# Altium project IMD test box finale.PrjPcb
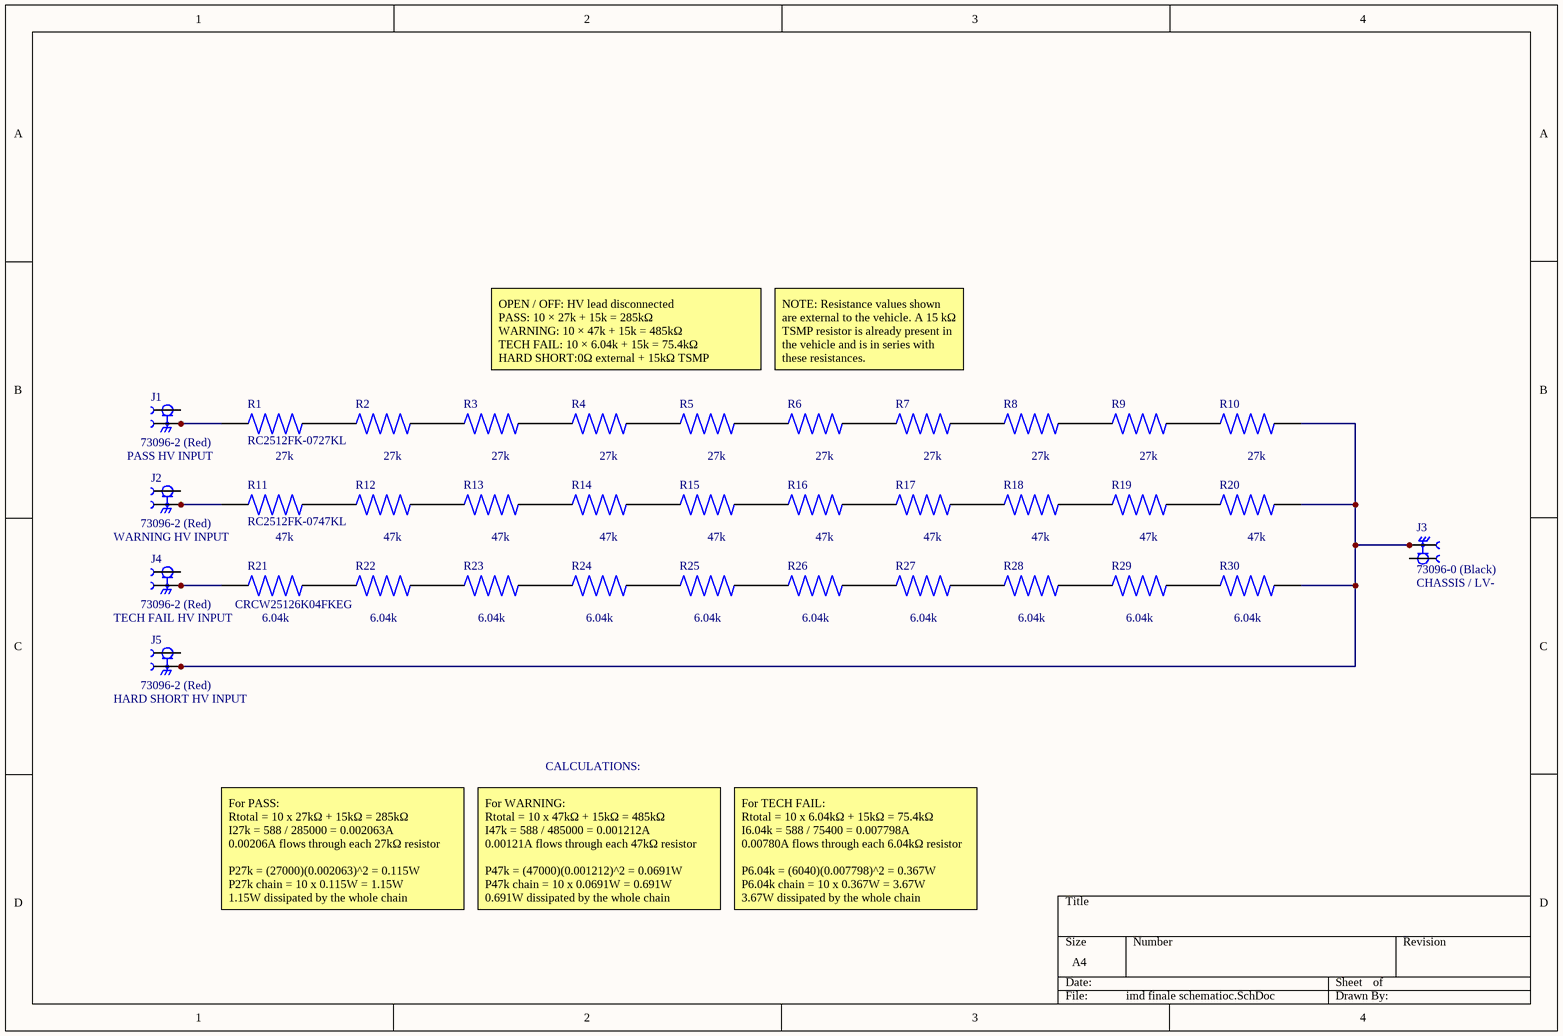
[diagram p0: imd finale schematioc.SchDoc]
1 sheet, 35 parts. Net scope: global (net labels, ports and power ports of the same name join across sheets).
Board files: pcb finale.PcbDoc, pcb test.PcbDoc

## Sheet imd finale schematioc.SchDoc
size A4; SheetNumber: 1; SheetTotal: 1

### Parts
J1  73096-2 (Red)  value PASS HV INPUT  [POMONA_73096-2]
J2  73096-2 (Red)  value WARNING HV INPUT  [POMONA_73096-2]
J3  73096-0 (Black)  value CHASSIS / LV-  [POMONA_73096-2]
J4  73096-2 (Red)  value TECH FAIL HV INPUT  [POMONA_73096-2]
J5  73096-2 (Red)  value HARD SHORT HV INPUT  [POMONA_73096-2]
R1  RC2512FK-0727KL  value 27k  [RESC6331X65N]
R2  value 27k  [RESC6331X65N]  (hidden comment: RC2512FK-0727KL)
R3  value 27k  [RESC6331X65N]  (hidden comment: RC2512FK-0727KL)
R4  value 27k  [RESC6331X65N]  (hidden comment: RC2512FK-0727KL)
R5  value 27k  [RESC6331X65N]  (hidden comment: RC2512FK-0727KL)
R6  value 27k  [RESC6331X65N]  (hidden comment: RC2512FK-0727KL)
R7  value 27k  [RESC6331X65N]  (hidden comment: RC2512FK-0727KL)
R8  value 27k  [RESC6331X65N]  (hidden comment: RC2512FK-0727KL)
R9  value 27k  [RESC6331X65N]  (hidden comment: RC2512FK-0727KL)
R10  value 27k  [RESC6331X65N]  (hidden comment: RC2512FK-0727KL)
R11  RC2512FK-0747KL  value 47k  [RESC6331X65N]
R12  value 47k  [RESC6331X65N]  (hidden comment: RC2512FK-0747KL)
R13  value 47k  [RESC6331X65N]  (hidden comment: RC2512FK-0747KL)
R14  value 47k  [RESC6331X65N]  (hidden comment: RC2512FK-0747KL)
R15  value 47k  [RESC6331X65N]  (hidden comment: RC2512FK-0747KL)
R16  value 47k  [RESC6331X65N]  (hidden comment: RC2512FK-0747KL)
R17  value 47k  [RESC6331X65N]  (hidden comment: RC2512FK-0747KL)
R18  value 47k  [RESC6331X65N]  (hidden comment: RC2512FK-0747KL)
R19  value 47k  [RESC6331X65N]  (hidden comment: RC2512FK-0747KL)
R20  value 47k  [RESC6331X65N]  (hidden comment: RC2512FK-0747KL)
R21  CRCW25126K04FKEG  value 6.04k  [RESC6331X70N]
R22  value 6.04k  [RESC6331X70N]  (hidden comment: CRCW25126K04FKEG)
R23  value 6.04k  [RESC6331X70N]  (hidden comment: CRCW25126K04FKEG)
R24  value 6.04k  [RESC6331X70N]  (hidden comment: CRCW25126K04FKEG)
R25  value 6.04k  [RESC6331X70N]  (hidden comment: CRCW25126K04FKEG)
R26  value 6.04k  [RESC6331X70N]  (hidden comment: CRCW25126K04FKEG)
R27  value 6.04k  [RESC6331X70N]  (hidden comment: CRCW25126K04FKEG)
R28  value 6.04k  [RESC6331X70N]  (hidden comment: CRCW25126K04FKEG)
R29  value 6.04k  [RESC6331X70N]  (hidden comment: CRCW25126K04FKEG)
R30  value 6.04k  [RESC6331X70N]  (hidden comment: CRCW25126K04FKEG)

### Nets
NetJ1_SH1: J1.SH1 J1.SH2 J1.SH3 J1.SH4 R1.1
NetJ2_SH1: J2.SH1 J2.SH2 J2.SH3 J2.SH4 R11.1
NetJ3_SH1: J3.SH1 J3.SH2 J3.SH3 J3.SH4 J5.SH1 J5.SH2 J5.SH3 J5.SH4 R10.2 R20.2 R30.2
NetJ4_SH1: J4.SH1 J4.SH2 J4.SH3 J4.SH4 R21.1
NetR1_2: R1.2 R2.1
NetR2_2: R2.2 R3.1
NetR3_2: R3.2 R4.1
NetR4_2: R4.2 R5.1
NetR5_2: R5.2 R6.1
NetR6_2: R6.2 R7.1
NetR7_2: R7.2 R8.1
NetR8_2: R8.2 R9.1
NetR9_2: R9.2 R10.1
NetR11_2: R11.2 R12.1
NetR12_2: R12.2 R13.1
NetR13_2: R13.2 R14.1
NetR14_2: R14.2 R15.1
NetR15_2: R15.2 R16.1
NetR16_2: R16.2 R17.1
NetR17_2: R17.2 R18.1
NetR18_2: R18.2 R19.1
NetR19_2: R19.2 R20.1
NetR21_2: R21.2 R22.1
NetR22_2: R22.2 R23.1
NetR23_2: R23.2 R24.1
NetR24_2: R24.2 R25.1
NetR25_2: R25.2 R26.1
NetR26_2: R26.2 R27.1
NetR27_2: R27.2 R28.1
NetR28_2: R28.2 R29.1
NetR29_2: R29.2 R30.1

Not connected (* = marked no-connect by the designer): J1 1; J2 1; J3 1; J4 1; J5 1

### Notes on the sheet
- OPEN / OFF: HV lead disconnected
  PASS: 10 × 27k + 15k = 285kΩ
  WARNING: 10 × 47k + 15k = 485kΩ
  TECH FAIL: 10 × 6.04k + 15k = 75.4kΩ
  HARD SHORT:0Ω external + 15kΩ TSMP
- NOTE: Resistance values shown are external to the vehicle. A 15 kΩ TSMP resistor is already present in the vehicle and is in series with these resistances.
- CALCULATIONS:
- For PASS:
  Rtotal = 10 x 27kΩ + 15kΩ = 285kΩ
  I27k = 588 / 285000 = 0.002063A
  0.00206A flows through each 27kΩ resistor
  P27k = (27000)(0.002063)^2 = 0.115W
  P27k chain = 10 x 0.115W = 1.15W
  1.15W dissipated by the whole chain
- For WARNING:
  Rtotal = 10 x 47kΩ + 15kΩ = 485kΩ
  I47k = 588 / 485000 = 0.001212A
  0.00121A flows through each 47kΩ resistor
  P47k = (47000)(0.001212)^2 = 0.0691W
  P47k chain = 10 x 0.0691W = 0.691W
  0.691W dissipated by the whole chain
- For TECH FAIL:
  Rtotal = 10 x 6.04kΩ + 15kΩ = 75.4kΩ
  I6.04k = 588 / 75400 = 0.007798A
  0.00780A flows through each 6.04kΩ resistor
  P6.04k = (6040)(0.007798)^2 = 0.367W
  P6.04k chain = 10 x 0.367W = 3.67W
  3.67W dissipated by the whole chain

### Library data of the parts
J1-J5 = 73096-2: MF: {'manufacturer': u'Pomona Electronics'}; Package: None; Price: None; MP: 73096-2; Availability: Unavailable
R1-R10 = RC2512FK-0727KL: 27 kOhms Â±1% 1W Chip Resistor 2512 (6332 Metric) Moisture Resistant Thick Film; MF: Yageo; SnapEDA_Link: https://www.snapeda.com/parts/RC2512FK-0727KL/Yageo/view-part/?ref=snap; Package: 6331 Yageo; MP: RC2512FK-0727KL; Check_prices: https://www.snapeda.com/parts/RC2512FK-0727KL/Yageo/view-part/?ref=eda
R11-R20 = RC2512FK-0747KL: 47 kOhms Â±1% 1W Chip Resistor 2512 (6332 Metric) Moisture Resistant Thick Film; MF: Yageo; SnapEDA_Link: https://www.snapeda.com/parts/RC2512FK-0747KL/Yageo/view-part/?ref=snap; Package: 6331 Yageo; MP: RC2512FK-0747KL; Check_prices: https://www.snapeda.com/parts/RC2512FK-0747KL/Yageo/view-part/?ref=eda
R21-R30 = CRCW25126K04FKEG: 6.04 kOhms Â±1% 1W Chip Resistor 2512 (6432 Metric) Automotive AEC-Q200 Thick Film; MF: Vishay Dale; SnapEDA_Link: https://www.snapeda.com/parts/CRCW25126K04FKEG/Vishay+Dale/view-part/?ref=snap; Package: 6331 Vishay; MP: CRCW25126K04FKEG; Check_prices: https://www.snapeda.com/parts/CRCW25126K04FKEG/Vishay+Dale/view-part/?ref=eda